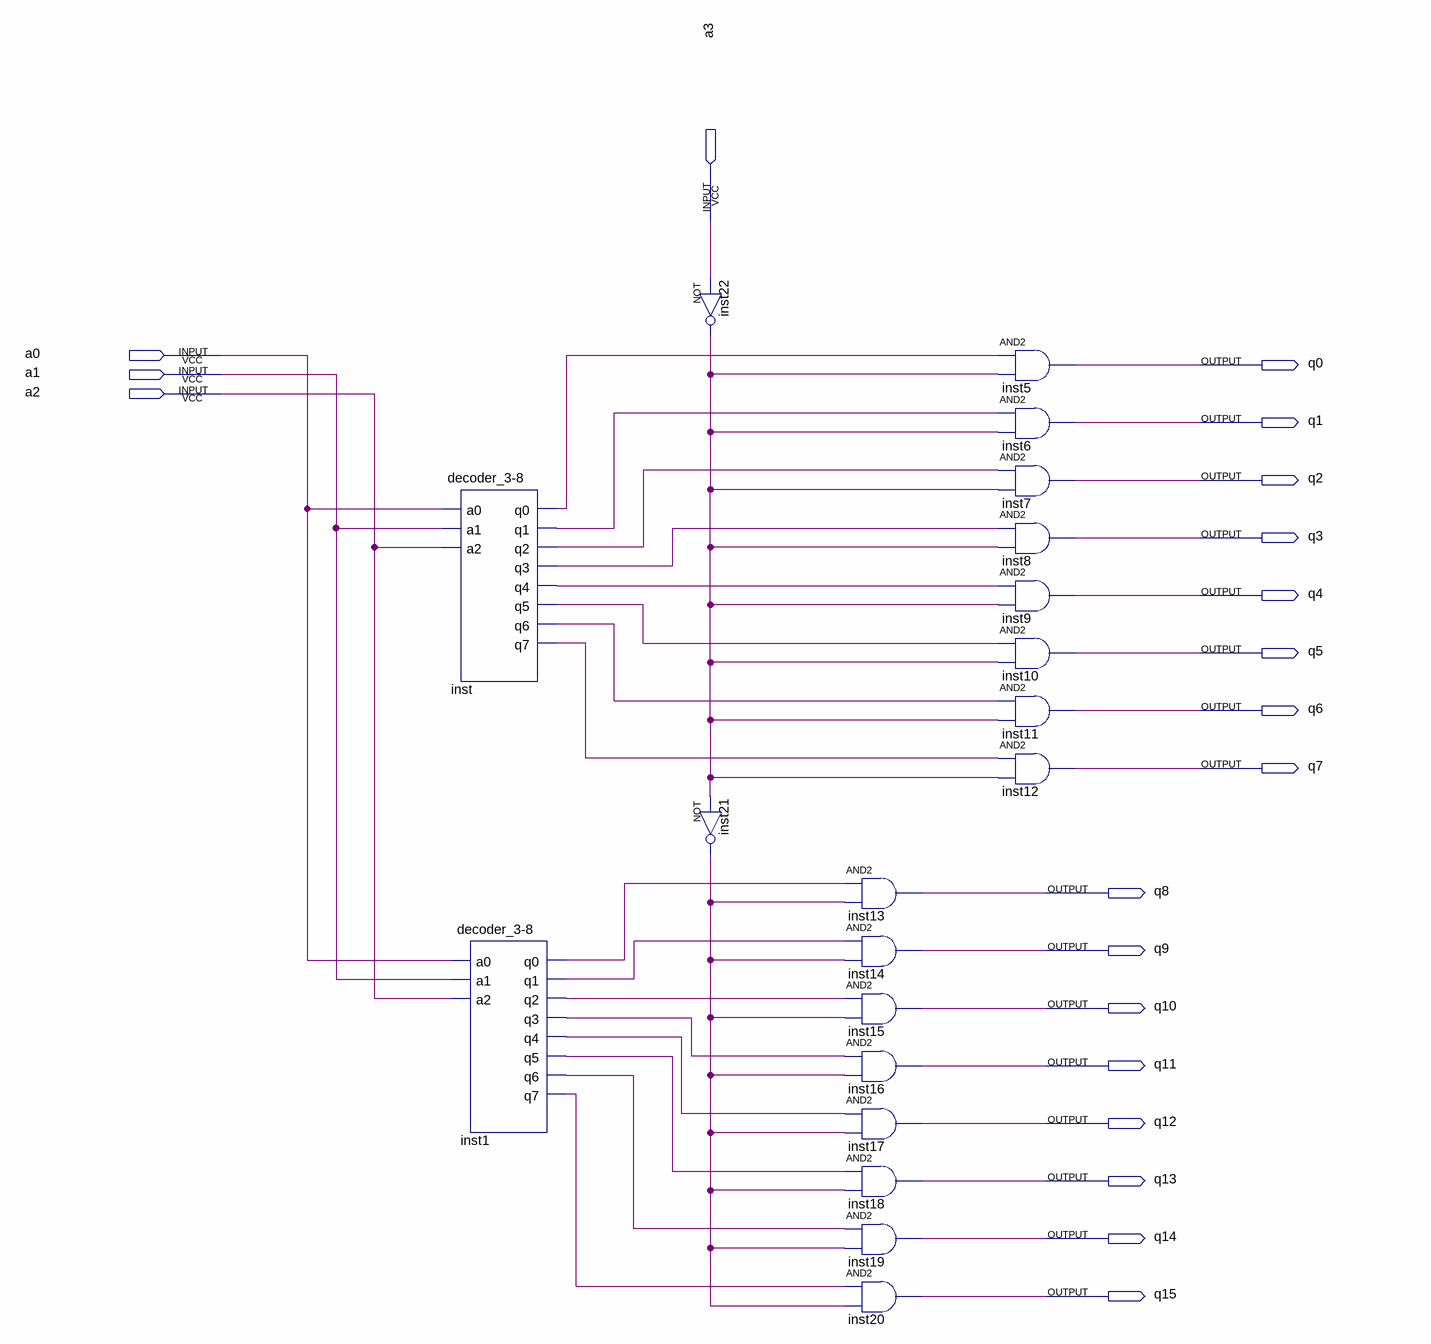
[diagram p0: schematic sheet]
// Quartus schematic decoder_4-16.bdf as structural Verilog: 20 symbols, 20 pins
module \decoder_4-16  (
  input  a3,
  input  a0,
  input  a1,
  input  a2,
  output q0,
  output q1,
  output q2,
  output q3,
  output q4,
  output q5,
  output q6,
  output q7,
  output q8,
  output q9,
  output q10,
  output q11,
  output q12,
  output q13,
  output q14,
  output q15
);

  wire inst1_q0, inst1_q1, inst1_q2, inst1_q3, inst1_q4, inst1_q5, inst1_q6, inst1_q7, inst21_out,
       inst22_out, inst_q0, inst_q1, inst_q2, inst_q3, inst_q4, inst_q5, inst_q6, inst_q7;

  \decoder_3-8  inst (
    .a0(a0), .a1(a1), .a2(a2), .q0(inst_q0), .q1(inst_q1), .q2(inst_q2), .q3(inst_q3), .q4(inst_q4),
    .q5(inst_q5), .q6(inst_q6), .q7(inst_q7));
  \decoder_3-8  inst1 (
    .a0(a0), .a1(a1), .a2(a2), .q0(inst1_q0), .q1(inst1_q1), .q2(inst1_q2), .q3(inst1_q3), .q4(inst1_q4),
    .q5(inst1_q5), .q6(inst1_q6), .q7(inst1_q7));
  not inst22 (inst22_out, a3);
  not inst21 (inst21_out, inst22_out);
  and inst13 (q8, inst1_q0, inst21_out);
  and inst14 (q9, inst1_q1, inst21_out);
  and inst15 (q10, inst1_q2, inst21_out);
  and inst16 (q11, inst1_q3, inst21_out);
  and inst17 (q12, inst1_q4, inst21_out);
  and inst18 (q13, inst1_q5, inst21_out);
  and inst19 (q14, inst1_q6, inst21_out);
  and inst20 (q15, inst1_q7, inst21_out);
  and inst5 (q0, inst_q0, inst22_out);
  and inst6 (q1, inst_q1, inst22_out);
  and inst7 (q2, inst_q2, inst22_out);
  and inst8 (q3, inst_q3, inst22_out);
  and inst9 (q4, inst_q4, inst22_out);
  and inst10 (q5, inst_q5, inst22_out);
  and inst11 (q6, inst_q6, inst22_out);
  and inst12 (q7, inst_q7, inst22_out);
endmodule
